# Altium schematic sheet Connector_Section.SchDoc
size A4; DocumentNumber: 27; SheetNumber: 27; SheetTotal: 27
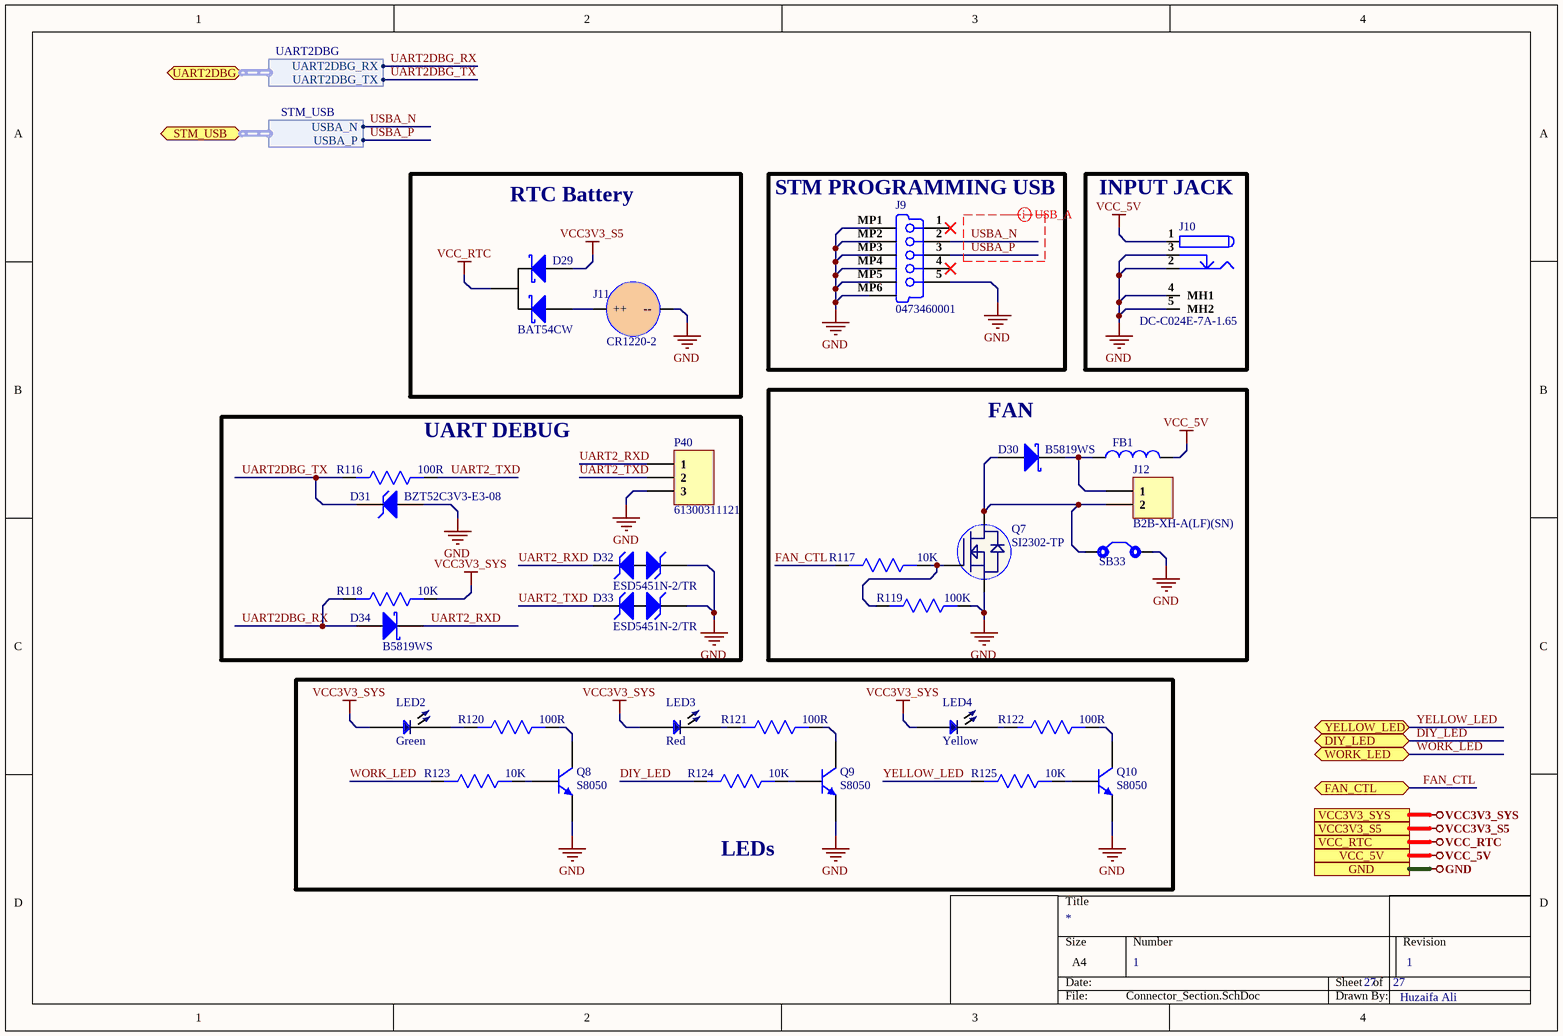
[diagram p0: Connector_Section.SchDoc]

## Parts
D29  BAT54CW  [SOT-323]
D30  B5819WS  [SOD-323]
D31  BZT52C3V3-E3-08  [SOD-123]
D32  ESD5451N-2/TR  [DFN1006-2L]
D33  ESD5451N-2/TR  [DFN1006-2L]
D34  B5819WS  [SOD-323]
FB1  MPZ1608S121ATDH5  [MPZ1608S121ATDH5]  (value not drawn)
J9  0473460001  [0473460001]
J10  DC-C024E-7A-1.65  [DC-C024E-7A-1.65]
J11  CR1220-2  [CR1220-2]
J12  B2B-XH-A(LF)(SN)  [B2B-XH-A(LF)(SN)]
LED2  Green  [LED 0402]
LED3  Red  [LED 0402]
LED4  Yellow  [LED 0402]
P40  61300311121  [HDR1X3]
Q7  SI2302-TP  [SI2302-TP]
Q8  S8050  [SOT23-3]
Q9  S8050  [SOT23-3]
Q10  S8050  [SOT23-3]
R116  100R  [Res0603]
R117  10K  [Res0603]
R118  10K  [Res0603]
R119  100K  [Res0603]
R120  100R  [Res0603]
R121  100R  [Res0603]
R122  100R  [Res0603]
R123  10K  [Res0603]
R124  10K  [Res0603]
R125  10K  [Res0603]
SB33  Solder Bridge  [Solder Bridge]  (value not drawn)

## Blocks framed on the sheet
RTC Battery: D29 J11
STM PROGRAMMING USB: J9
INPUT JACK: J10
FAN: D30 FB1 J12 Q7 R117 R119 SB33
UART DEBUG: D31-D34 P40 R116 R118
LEDs: LED2-LED4 Q8-Q10 R120-R125

## Ports
DIY_LED (bidir), FAN_CTL (bidir), GND, STM_USB (bidir, harness STM_USB), UART2DBG (bidir, harness UART2DBG), VCC3V3_S5, VCC3V3_SYS, VCC_5V, VCC_RTC, WORK_LED (bidir), YELLOW_LED (bidir)

## Harnesses
STM_USB: USBA_N, USBA_P
UART2DBG: UART2DBG_TX, UART2DBG_RX

## Nets
GND: D31.1(A) D32.2(k) D33.2(k) J9.5(GND) J9.MP1(Tab) J9.MP2(Tab) J9.MP3(Tab) J9.MP4(Tab) J9.MP5(Tab) J9.MP6(Tab) J10.2 J10.3 J10.4(MH1) J10.5(MH2) J11.2(--) P40.3 Q7.2(S) Q8.2(E) Q9.2(E) Q10.2(E) R119.1 SB33.2 ; port GND
VCC3V3_S5: D29.2(A2) ; port VCC3V3_S5
VCC3V3_SYS: LED2.1 LED3.1 LED4.1 R118.1 ; port VCC3V3_SYS
VCC_5V: FB1.2 J10.1 ; port VCC_5V
VCC_RTC: D29.3(K) ; port VCC_RTC
DIY_LED: R124.2 ; port DIY_LED
FAN_CTL: R117.2 ; port FAN_CTL
UART2_RXD: D32.1(K) D34.1(K) P40.1
UART2_TXD: D33.1(K) P40.2 R116.1
UART2DBG_RX: D34.2(A) R118.2 ; port UART2DBG.UART2DBG_RX
UART2DBG_TX: D31.2(K) R116.2 ; port UART2DBG.UART2DBG_TX
USBA_N: J9.2(D-) ; port STM_USB.USBA_N
USBA_P: J9.3(D+) ; port STM_USB.USBA_P
WORK_LED: R123.2 ; port WORK_LED
YELLOW_LED: R125.2 ; port YELLOW_LED
NetD29_1: D29.1(A1) J11.1(++)
NetD30_1: D30.1(K) FB1.1 J12.1
NetD30_2: D30.2(A) J12.2 Q7.3(D) SB33.1
NetLED2_2: LED2.2 R120.2
NetLED3_2: LED3.2 R121.2
NetLED4_2: LED4.2 R122.2
NetQ7_1: Q7.1(G) R117.1 R119.2
NetQ8_1: Q8.1(B) R123.1
NetQ8_3: Q8.3(C) R120.1
NetQ9_1: Q9.1(B) R124.1
NetQ9_3: Q9.3(C) R121.1
NetQ10_1: Q10.1(B) R125.1
NetQ10_3: Q10.3(C) R122.1

Not connected (* = marked no-connect by the designer): J9 1(V_BUS_(5V))* 4(ID)*; J11 MH1 MH2

## Layout directives
differential pair; rule Matched Net Lengths [Tolerance = 50mil]; rule Impedance Constraint [Min = 85.00    Max = 95.00    ]; differential pair class USB_A_Lines; net class USB_A: USBA_N, USBA_P

## Notes on the sheet
- 1
- Huzaifa Ali

## Library data of the parts
D29 = BAT54CW: DIODE SCHOTTKY 30V 100MA SOT323; Manufacturer: ON Semiconductor / Fairchild; Manufacturer Part Number: BAT54CWT1G; Element Configuration: Common Cathode; Forward Current: 200mA; Forward Voltage: 800mV; Reverse Recovery Time: 5ns; Peak Non-Repetitive Surge Current: 600mA; Max Reverse Current: 2uA; Power Dissipation: 200mW; Supplier 1: Mouser; RoHS: Yes; Category: Schottky Diodes; Pricing 1: 1=0.22000, 10=0.18400, 50=0.18400, 100=0.09800, 500=0.06400, 1000=0.04400, 3000=0.03400, 10000=0.03400 (USD); Mount: Surface Mount; Case/Package: SOT-323; Number of Pins: 3; Contact Plating: Tin,Matte; Weight: 0.03g; Min Operating Temperature: -55°C; Max Operating Temperature: 125°C; Packaging: Tape and Reel; Package Quantity: 1; Max Repetitive Reverse Voltage (Vrrm): 30V; Average Rectified Current: 200mA; Max Forward Surge Current (Ifsm): 600mA; Max Reverse Voltage (DC): 30V; Max Surge Current: 600mA; Max Reverse Leakage Current: 2uA; Series: -; Recovery Time: 5ns; Length: 2.2mm; Width: 1.35mm; Height: 0.9mm; Radiation Hardening: No; RoHS Compliant: Yes; Lead Free: Lead Free; REACH SVHC: No SVHC; ComponentLink1URL: https://datasheet.ciiva.com/905/bat54cwt1-d-905845.pdf?src-supplier=Digi-Key; ComponentLink1Description: https://datasheet.ciiva.com/905/bat54cwt1-d-905845.pdf?src-supplier=Digi-Key; ComponentLink2URL: https://datasheet.ciiva.com/28381/1708235-28381253.pdf?src-supplier=Element14; ComponentLink2Description: https://datasheet.ciiva.com/28381/1708235-28381253.pdf?src-supplier=Element14; ComponentLink3URL: https://datasheet.ciiva.com/22651/1706529-22651951.pdf?src-supplier=Element14; ComponentLink3Description: https://datasheet.ciiva.com/22651/1706529-22651951.pdf?src-supplier=Element14; ComponentLink4URL: https://datasheet.ciiva.com/4715/bat54cwt1g-102392-4715466.pdf?src-supplier=Mouser; ComponentLink4Description: https://datasheet.ciiva.com/4715/bat54cwt1g-102392-4715466.pdf?src-supplier=Mouser; ComponentLink5URL: https://datasheet.ciiva.com/4715/bat54cwt1-d-111181-4715156.pdf?src-supplier=Mouser; ComponentLink5Description: https://datasheet.ciiva.com/4715/bat54cwt1-d-111181-4715156.pdf?src-supplier=Mouser; ComponentLink6URL: https://datasheet.ciiva.com/22659/1708235-22659015.pdf?src-supplier=Element14; ComponentLink6Description: https://datasheet.ciiva.com/22659/1708235-22659015.pdf?src-supplier=Element14; ComponentLink7URL: https://datasheet.ciiva.com/8303/bat54cwt1g-8303708.pdf?src-supplier=Avnet; ComponentLink7Description: https://datasheet.ciiva.com/8303/bat54cwt1g-8303708.pdf?src-supplier=Avnet; ComponentLink8URL: https://datasheet.ciiva.com/8303/bat54cwt1g-8303706.pdf?src-supplier=Avnet; ComponentLink8Description: https://datasheet.ciiva.com/8303/bat54cwt1g-8303706.pdf?src-supplier=Avnet; ComponentLink9URL: https://datasheet.ciiva.com/6390/bat54cwt1g-6390474.pdf?src-supplier=Digi-Key; ComponentLink9Description: https://datasheet.ciiva.com/6390/bat54cwt1g-6390474.pdf?src-supplier=Digi-Key; ComponentLink10URL: https://datasheet.ciiva.com/905/bat54cwt1-d-905846.pdf?src-supplier=Digi-Key; ComponentLink10Description: https://datasheet.ciiva.com/905/bat54cwt1-d-905846.pdf?src-supplier=Digi-Key; ComponentLink11URL: https://datasheet.ciiva.com/905/bat54cwt1-d-905847.pdf?src-supplier=Digi-Key; ComponentLink11Description: https://datasheet.ciiva.com/905/bat54cwt1-d-905847.pdf?src-supplier=Digi-Key; Supplier Part Number 1: 863-BAT54CWT1G
D30 D34 = B5819WS: DIODE SCHOTTKY 40V 1A SOD323; Manufacturer: MDD; Manufacturer Part Number: B5819WS-TP; Max Surge Current: 10A; Forward Voltage: 900mV; Max Reverse Leakage Current: 1mA; Element Configuration: Single; Supplier 1: Arrow Electronics; RoHS: Yes; Category: Rectifier Diodes; Stock 1: 1701; Pricing 1: 1=0.34370, 10=0.18990, 25=0.18810, 100=0.11820, 250=0.11700, 500=0.08890, 1000=0.07420 (USD); Mount: Surface Mount; Number of Pins: 2; Min Operating Temperature: -65°C; Max Operating Temperature: 125°C; Package Quantity: 1; Packaging: Tape and Reel; Average Rectified Current: 1A; Peak Non-Repetitive Surge Current: 10A; Max Reverse Voltage (DC): 40V; Series: -; Radiation Hardening: No; RoHS Compliant: Yes; Lead Free: Lead Free; Supplier Part Number 1: B5819WS-TP; ComponentLink1Description: LCSC; ComponentLink1URL: https://lcsc.com/product-detail/Schottky-Barrier-Diodes-SBD_MDD-Microdiode-Electronics-B5819WS_C64886.html
D31 = BZT52C3V3-E3-08: Diode Zener Single 3.3V 6% 500mW 2-Pin SOD-123; Manufacturer: Vishay; Max Power Dissipation: 410mW; Impedance: 80R; Voltage Tolerance: 5%; Zener Current: 109mA; Max Reverse Leakage Current: 100nA; Test Current: 5mA; ESD Protection: Yes; Supplier 1: Newark; Manufacturer Part Number: BZT52C3V3-E3-08; RoHS: Yes; Category: Zener Diodes; Pricing 1: 1=0.28100, 10=0.19500, 25=0.16300, 50=0.13100, 100=0.09800, 250=0.09200, 500=0.08500, 1000=0.05700 (USD); Mount: Surface Mount; Number of Pins: 2; Contact Plating: Tin,Matte; Min Operating Temperature: -55°C; Max Operating Temperature: 150°C; Zener Voltage: 3.3V; Element Configuration: Single; Power Dissipation: 500mW; Packaging: Tape and Reel; Package Quantity: 3000; Tolerance: 5%; Radiation Hardening: No; ComponentLink1URL: https://datasheet.ciiva.com/24094/bzt52-106265-24094953.pdf?src-supplier=Mouser; ComponentLink1Description: https://datasheet.ciiva.com/24094/bzt52-106265-24094953.pdf?src-supplier=Mouser; Supplier Part Number 1: 06AC5888
D32 D33 = ESD5451N-2/TR: DFN1006-2L ESD Protection Devices ROHS; Manufacturer: WILLSEMI; ComponentLink1Description: LCSC; ComponentLink1URL: https://www.lcsc.com/product-detail/TVS_Will-Semicon-ESD5451N-2-TR_C239604.html; Manufacturer Part Number: ESD5451N-2/TR
FB1 = MPZ1608S121ATDH5: FERRITE BEAD 120 OHM 0603 1LN; Manufacturer: TDK; Number of Lines: 1; Max Current Rating: 2A; DC Resistance (DCR): 45mR; Impedance: 120R; Tolerance: 25%; Test Frequency: 100MHz; Supplier 1: Digi-Key; Manufacturer Part Number: MPZ1608S121ATDH5; RoHS: Yes; Category: Ferrite Beads and Chips; Pricing 1: 1=0.11000, 10=0.08600, 25=0.07720, 50=0.05660, 100=0.04890, 250=0.03860, 500=0.03260, 1000=0.02746 (USD); Mount: Surface Mount; Case/Package: 0603; Case Code (Metric): 1608; Case Code (Imperial): 0603; Weight: 7.1E-05oz; Min Operating Temperature: -55°C; Max Operating Temperature: 125°C; Package Quantity: 4000; Packaging: Tape and Reel; Termination: SMD/SMT; Max DC Current: 2A; Length: 0.063inch; Width: 0.031inch; Height: 0.03inch; Ratings: AEC-Q200; RoHS Compliant: Yes; ComponentLink1URL: https://media.digikey.com/pdf/Data%20Sheets/TDK%20PDFs/MPZ_Series_Br.pdf?src-supplier=Digi-Key; ComponentLink1Description: https://media.digikey.com/pdf/Data%20Sheets/TDK%20PDFs/MPZ_Series_Br.pdf?src-supplier=Digi-Key; ComponentLink2URL: http://www.mouser.com/ds/2/400/eads_commercial_power_mpz1608_en-923650.pdf?src-supplier=Mouser; ComponentLink2Description: http://www.mouser.com/ds/2/400/eads_commercial_power_mpz1608_en-923650.pdf?src-supplier=Mouser; ComponentLink3URL: https://product.tdk.com/info/en/catalog/datasheets/beads_automotive_power_mpz1608_en.pdf?src-supplier=Digi-Key; ComponentLink3Description: https://product.tdk.com/info/en/catalog/datasheets/beads_automotive_power_mpz1608_en.pdf?src-supplier=Digi-Key; Supplier Part Number 1: 445-172891-6-ND
J9 = 0473460001: Micro-USB B Receptacle with Flange, Bottom Mount, Surface Mount, Lead-Free; Manufacturer: Molex; Manufacturer Part Number: 47346-0001; Supplier 1: Digi-Key; RoHS: Yes; Category: Headers and Wire Housings; Stock 1: 9395; Pricing 1: 1=1.10000, 10=0.91200, 100=0.75980, 1000=0.60782 (USD); ComponentLink1URL: https://datasheet.ciiva.com/30075/304740473460001-io-nectors-30075527.pdf?src-supplier=Onlinecomponents.com; ComponentLink1Description: https://datasheet.ciiva.com/30075/304740473460001-io-nectors-30075527.pdf?src-supplier=Onlinecomponents.com; ComponentLink2URL: https://datasheet.ciiva.com/22654/1630785-22654942.pdf?src-supplier=Element14; ComponentLink2Description: https://datasheet.ciiva.com/22654/1630785-22654942.pdf?src-supplier=Element14; ComponentLink3URL: https://datasheet.ciiva.com/16148/1700180473460001-io-nectors-16148917.pdf?src-supplier=Onlinecomponents.com; ComponentLink3Description: https://datasheet.ciiva.com/16148/1700180473460001-io-nectors-16148917.pdf?src-supplier=Onlinecomponents.com; ComponentLink4URL: https://datasheet.ciiva.com/11731/0900766b80dfe0a7-11731298.pdf?src-supplier=RSComponents; ComponentLink4Description: https://datasheet.ciiva.com/11731/0900766b80dfe0a7-11731298.pdf?src-supplier=RSComponents; ComponentLink5URL: https://datasheet.ciiva.com/1098/1698067-1098476.pdf?src-supplier=Element14; ComponentLink5Description: https://datasheet.ciiva.com/1098/1698067-1098476.pdf?src-supplier=Element14; ComponentLink6URL: https://datasheet.ciiva.com/4598/0473460001-io-connectors-146446-4598841.pdf?src-supplier=Mouser; ComponentLink6Description: https://datasheet.ciiva.com/4598/0473460001-io-connectors-146446-4598841.pdf?src-supplier=Mouser; ComponentLink7URL: https://datasheet.ciiva.com/28504/0473460001-io-connectors-28504587.pdf?src-supplier=Element14; ComponentLink7Description: https://datasheet.ciiva.com/28504/0473460001-io-connectors-28504587.pdf?src-supplier=Element14; ComponentLink8URL: https://datasheet.ciiva.com/46390/1681853-46390956.pdf?src-supplier=Element14; ComponentLink8Description: https://datasheet.ciiva.com/46390/1681853-46390956.pdf?src-supplier=Element14; ComponentLink9URL: https://datasheet.ciiva.com/16986/70266948-16986683.pdf?src-supplier=Allied+Electronics; ComponentLink9Description: https://datasheet.ciiva.com/16986/70266948-16986683.pdf?src-supplier=Allied+Electronics; Supplier Part Number 1: WM17141DKR-ND
J10 = DC-C024E-7A-1.65: DC Power Receptacle 1.65mm 4.3mm 7A 24V Plugin AC/DC Power Connectors ROHS; Manufacturer: XKB Connectivity; Maunfacturer Part Number: DC-C024E-7A-1.65; Footprint: Custom; ComponentLink1Description: LCSC; ComponentLink1URL: https://lcsc.com/product-detail/AC-span-style-background-color-ff0-DC-span-Power-Connectors_XKB-Connectivity-DC-C024E-7A-1-65_C397335.html
J11 = CR1220-2: SMD Battery Holders, Clips & Contacts RoHS; Manufacturer: Q&J; Value: Cuctom; Manufacturer Part No: CR1220-2; Package: Cuctom
J12 = B2B-XH-A(LF)(SN): Conn Shrouded Header (4 Sides) HDR 2 POS 2.5mm Solder ST Thru-Hole Box; Manufacturer: JST; Number of Positions: 2; Connector Type: Male Pin; Current Rating: 3A; Contact Resistance: 20mR; Voltage Rating: 250V; Insulation Resistance: 1GR; Wire/Cable Gauge: 22AWG; Supplier 1: Farnell; Manufacturer Part Number: B2B-XH-A(LF)(SN); RoHS: Yes; Category: FFC / FPC; Stock 1: 219240; Pricing 1: 100=0.06860, 1000=0.04800, 2500=0.04520, 5000=0.04230, 10000=0.03950, 20000=0.03660 (GBP); Mount: Through Hole; Contact Plating: Tin,Copper,Lead; Color: Natural; Contact Material: Brass; Housing Color: White; Housing Material: Polyamide; Min Operating Temperature: -25°C; Max Operating Temperature: 85°C; Number of Rows: 1; Packaging: Bulk; Termination: Solder; Fastening Type: Detent; Max Current Rating: 3A; Voltage Rating (AC): 250V; Max Voltage Rating (AC): 250V; Number of Contacts: 2; Max Voltage Rating (DC): 250V; Orientation: Straight; Length: 7.4mm; Pitch: 2.5mm; Lead Pitch: 2.5mm; Depth: 5.75mm; REACH SVHC: No SVHC; Lead Free: Lead Free; ComponentLink1URL: https://datasheet.ciiva.com/26894/getdatasheetpartid-640357-26894434.pdf?src-supplier=Verical; ComponentLink1Description: https://datasheet.ciiva.com/26894/getdatasheetpartid-640357-26894434.pdf?src-supplier=Verical; ComponentLink2URL: https://datasheet.ciiva.com/11746/0900766b8082653e-11746979.pdf?src-supplier=RSComponents; ComponentLink2Description: https://datasheet.ciiva.com/11746/0900766b8082653e-11746979.pdf?src-supplier=RSComponents; ComponentLink3URL: https://datasheet.ciiva.com/26894/getdatasheetpartid-385291-26894760.pdf?src-supplier=Verical; ComponentLink3Description: https://datasheet.ciiva.com/26894/getdatasheetpartid-385291-26894760.pdf?src-supplier=Verical; ComponentLink4URL: https://datasheet.ciiva.com/8052/5448-8052024.pdf?src-supplier=Element14; ComponentLink4Description: https://datasheet.ciiva.com/8052/5448-8052024.pdf?src-supplier=Element14; ComponentLink5URL: https://datasheet.ciiva.com/20207/523653-20207167.pdf?src-supplier=Rapid+Electronics; ComponentLink5Description: https://datasheet.ciiva.com/20207/523653-20207167.pdf?src-supplier=Rapid+Electronics; Supplier Part Number 1: 1516276
LED2 = XZVG68W-2: LED GREEN CLEAR CHIP SMD; Manufacturer: SunLED; Lens Color: Colorless; Luminous Intensity: 49mcd; Test Current: 20mA; Viewing Angle: 120°; Dominant Wavelength: 570nm; Forward Voltage: 2.1V; Supplier 1: Digi-Key; Manufacturer Part Number: XZVG68W-2; Stock 1: 4185; Pricing 1: 1=0.5, 10=0.36, 100=0.16, 500=0.112, 1000=0.092 (USD); Mount: Surface Mount; Case/Package: 0402; Color: Green; Case Code (Metric): 1005; Case Code (Imperial): 0402; Packaging: Tape and Reel; Lens Transparency: Clear; Length: 1mm; Height: 0.6mm; Width: 0.5mm; ComponentLink1URL: http://www.sunledusa.com/products/spec/XZVG68W-2.pdf?src-supplier=Digi-Key; ComponentLink1Description: http://www.sunledusa.com/products/spec/XZVG68W-2.pdf?src-supplier=Digi-Key; ComponentLink2URL: https://www.sunledusa.com/products/spec/XZVG68W-2.pdf?src-supplier=Digi-Key; ComponentLink2Description: https://www.sunledusa.com/products/spec/XZVG68W-2.pdf?src-supplier=Digi-Key; Supplier Part Number 1: 1497-1219-6-ND
LED3 = XZMDK68W-2: LED RED CLEAR CHIP SMD; Manufacturer: SunLED; Lens Color: Colorless; Luminous Intensity: 69mcd; Test Current: 20mA; Viewing Angle: 120°; Dominant Wavelength: 630nm; Forward Voltage: 1.95V; Supplier 1: Digi-Key; Manufacturer Part Number: XZMDK68W-2; Stock 1: 69539; Pricing 1: 1=0.43, 10=0.306, 100=0.136, 500=0.0952, 1000=0.0782 (USD); Mount: Surface Mount; Case/Package: 0402; Color: Red; Case Code (Metric): 1005; Case Code (Imperial): 0402; Packaging: Tape and Reel; Lens Transparency: Clear; Length: 1mm; Height: 0.6mm; Width: 0.5mm; ComponentLink1URL: http://www.sunledusa.com/products/spec/XZMDK68W-2.pdf?src-supplier=Digi-Key; ComponentLink1Description: http://www.sunledusa.com/products/spec/XZMDK68W-2.pdf?src-supplier=Digi-Key; ComponentLink2URL: https://www.sunledusa.com/products/spec/XZMDK68W-2.pdf?src-supplier=Digi-Key; ComponentLink2Description: https://www.sunledusa.com/products/spec/XZMDK68W-2.pdf?src-supplier=Digi-Key; Supplier Part Number 1: 1497-1174-6-ND
LED4 = XZMYK68W-2: LED YELLOW CLEAR CHIP SMD; Manufacturer: SunLED; Lens Color: Colorless; Luminous Intensity: 148mcd; Test Current: 20mA; Viewing Angle: 120°; Dominant Wavelength: 590nm; Forward Voltage: 2V; Supplier 1: Digi-Key; Manufacturer Part Number: XZMYK68W-2; RoHS: Yes; Category: LEDs; Stock 1: 36021; Pricing 1: 1=0.36000, 10=0.28400, 100=0.12770, 500=0.11536, 1000=0.09476 (USD); Mount: Surface Mount; Case/Package: 0402; Color: Yellow; Case Code (Metric): 1005; Case Code (Imperial): 0402; Packaging: Tape and Reel; Lens Transparency: Clear; Length: 1mm; Width: 0.5mm; Height: 0.6mm; RoHS Compliant: Yes; ComponentLink1URL: http://www.sunledusa.com/products/spec/XZMYK68W-2.pdf?src-supplier=Digi-Key; ComponentLink1Description: http://www.sunledusa.com/products/spec/XZMYK68W-2.pdf?src-supplier=Digi-Key; Supplier Part Number 1: 1497-1198-1-ND
P40 = 61300311121: CONN HEADER VERT 3POS 2.54MM; Manufacturer: Wurth Electronics; Number of Positions: 3; Gender: Male; Connector Type: Male Pin; Pitch: 0.1inch; Supplier 1: Digi-Key; Manufacturer Part Number: 61300311121; Stock 1: 81286; Pricing 1: 1=0.13, 10=0.106, 25=0.088, 50=0.074, 100=0.067, 1000=0.061 (USD); Mount: Through Hole; Contact Plating: Gold; Contact Material: Copper; Color: Black; Number of Rows: 1; Packaging: Bulk; Termination: Solder; Number of Contacts: 3; Contact Mating Length: 0.236inch; REACH SVHC: Unknown; Lead Free: Lead Free; ComponentLink1URL: http://www.farnell.com/cad/1737268.pdf?src-supplier=Element14; ComponentLink1Description: http://www.farnell.com/cad/1737268.pdf?src-supplier=Element14; ComponentLink2URL: https://katalog.we-online.de/em/datasheet/6130xx11121.pdf?src-supplier=Digi-Key; ComponentLink2Description: https://katalog.we-online.de/em/datasheet/6130xx11121.pdf?src-supplier=Digi-Key; Supplier Part Number 1: 732-5316-ND
Q7 = SI2302-TP: SI2302 Series 20 3 A N-Ch Enhancement Mode Field Effect Transistor - SOT-23-3; Manufacturer: MCC; Rds On Max: 72mR; Input Capacitance: 237pF; Drain to Source Voltage (Vdss): 20V; Continuous Drain Current (ID): 3A; Max Power Dissipation: 1.25W; Drain to Source Resistance: 110mR; Number of Elements: 1; Gate to Source Voltage (Vgs): 8V; Polarity: N-CHANNEL; Supplier 1: Digi-Key; Manufacturer Part Number: SI2302-TP; RoHS: Yes; Category: Transistors; Stock 1: 13753; Pricing 1: 1=0.50000, 10=0.40300, 100=0.27460, 500=0.20592, 1000=0.15444 (USD); Mount: Surface Mount; Case/Package: SOT-23; Number of Pins: 3; Min Operating Temperature: -55°C; Max Operating Temperature: 150°C; Packaging: Tape and Reel; Package Quantity: 3000; Drain to Source Breakdown Voltage: 20V; Power Dissipation: 1.25W; Lead Free: Lead Free; RoHS Compliant: Yes; ComponentLink1URL: https://datasheet.ciiva.com/935/si2302sot-23-935107.pdf?src-supplier=Digi-Key; ComponentLink1Description: https://datasheet.ciiva.com/935/si2302sot-23-935107.pdf?src-supplier=Digi-Key; ComponentLink2URL: https://datasheet.ciiva.com/935/si2302sot-23-935109.pdf?src-supplier=Digi-Key; ComponentLink2Description: https://datasheet.ciiva.com/935/si2302sot-23-935109.pdf?src-supplier=Digi-Key; ComponentLink3URL: https://datasheet.ciiva.com/935/si2302sot-23-935108.pdf?src-supplier=Digi-Key; ComponentLink3Description: https://datasheet.ciiva.com/935/si2302sot-23-935108.pdf?src-supplier=Digi-Key; Supplier Part Number 1: SI2302-TPMSCT-ND
Q8-Q10 = S8050: Trans Gp Bjt NPN 25V 1.5A 300MW 3-PIN SOT-23 T/r; Manufacturer: Comchip; Manufacturer Part Number: SS8050-G; Collector Emitter Voltage (VCEO): 400mV; Transition Frequency: 100MHz; Supplier 1: Arrow Electronics; RoHS: Yes; Stock 1: 2514; Pricing 1: 1=0.26480, 10=0.19960, 25=0.19760, 50=0.19590, 100=0.09990, 250=0.09890, 500=0.07670, 1000=0.05180 (USD); Mount: Surface Mount; Case/Package: TO-236-3; Packaging: Tape and Reel; Max Power Dissipation: 300mW; Max Collector Current: 1.5A; Collector Emitter Breakdown Voltage: 25V; Max Breakdown Voltage: 25V; ComponentLink1URL: http://www.comchiptech.com/admin/files/product/SS8050-G RevA181526.pdf?src-supplier=Digi-Key; ComponentLink1Description: http://www.comchiptech.com/admin/files/product/SS8050-G RevA181526.pdf?src-supplier=Digi-Key; ComponentLink2URL: http://www.comchiptech.com/cms/UserFiles/SS8050-G%20RevA181526.pdf?src-supplier=Digi-Key; ComponentLink2Description: http://www.comchiptech.com/cms/UserFiles/SS8050-G%20RevA181526.pdf?src-supplier=Digi-Key; Supplier Part Number 1: SS8050-G
R116 R120-R122 = FRC0603J101 TS: 100mW Thick Film Resistors 50V ±5% ±100ppm/℃ -55℃~+155℃ 100Ω 0603 Chip Resistor - Surface Mount ROHS; Manufacturer: FOJAN; Manufacturer Part Number: FRC0603J101 TS; Value: 100R; Footprint: 0603
R117 R118 R123-R125 = AC0603JR-0710KL: RES SMD 10K OHM 5% 1/10W 0603; Manufacturer: Yageo; Voltage Rating: 50V; Resistance: 10kR; Power Rating: 100mW; Temperature Coefficient: 100ppm/°C; Supplier 1: Future Electronics; Manufacturer Part Number: AC0603JR-0710KL; RoHS: Yes; Category: Chip SMD Resistors; Stock 1: 1533000; Pricing 1: 5000=0.00540 (USD); Case/Package: 0603; Case Code (Imperial): 0603; Case Code (Metric): 1608; Size Code: 0603; Min Operating Temperature: -55°C; Max Operating Temperature: 155°C; Packaging: Tape and Reel; Tolerance: 5%; Package Quantity: 1; Resistor Type: Thick Film; Termination: SMD/SMT; Number of Terminations: 2; Max Power Dissipation: 100mW; Features: Moisture Resistant,Automotive AEC-Q200,Anti-Sulfur; Series: AC; Construction: Rectangular; Length: 0.063inch; Width: 0.031inch; Height: 0.022inch; Depth: 0.8mm; Military Standard: Not; Lead Free: Lead Free; RoHS Compliant: Yes; ComponentLink1URL: https://datasheet.ciiva.com/5562/pyu-ac-51-rohs-l-2-5562553.pdf?src-supplier=Mouser; ComponentLink1Description: https://datasheet.ciiva.com/5562/pyu-ac-51-rohs-l-2-5562553.pdf?src-supplier=Mouser; Supplier Part Number 1: 1029044
R119 = RT0603BRD07100KL: RES SMD 100K OHM 0.1% 1/10W 0603; Manufacturer: Yageo; Resistance: 100kR; Temperature Coefficient: 25ppm/°C; Voltage Rating (DC): 75V; Power Rating: 100mW; Supplier 1: Digi-Key; Manufacturer Part Number: RT0603BRD07100KL; Stock 1: 53395; Pricing 1: 1=0.39, 10=0.332, 100=0.1298, 1000=0.05435, 2500=0.04982 (USD); Mount: Surface Mount; Case/Package: 0603; Case Code (Imperial): 0603; Case Code (Metric): 1608; Min Operating Temperature: -55°C; Max Operating Temperature: 125°C; Tolerance: 0.1%; Composition: Thin Film; Packaging: Tape and Reel; Voltage Rating: 75V; Package Quantity: 5000; Termination: SMD/SMT; Number of Terminations: 2; Military Standard: Not; Max Power Dissipation: 100mW; Working Voltage: 75V; Features: Moisture Resistant; Length: 1.6mm; Height: 0.022inch; Width: 0.031inch; Depth: 0.8mm; Lead Free: Lead Free; ComponentLink1URL: http://documents.rs-components.com/techlib://itc_doclist_GB.htm?stockno=6174810&src-supplier=RSComponents; ComponentLink1Description: http://documents.rs-components.com/techlib://itc_doclist_GB.htm?stockno=6174810&src-supplier=RSComponents; Supplier Part Number 1: YAG1235CT-ND
SB33 = Solder Bridge: Solder Bridge ON